# Altium schematic sheet Connection Powermodule.SchDoc
size A4; SheetNumber: 3; SheetTotal: 6
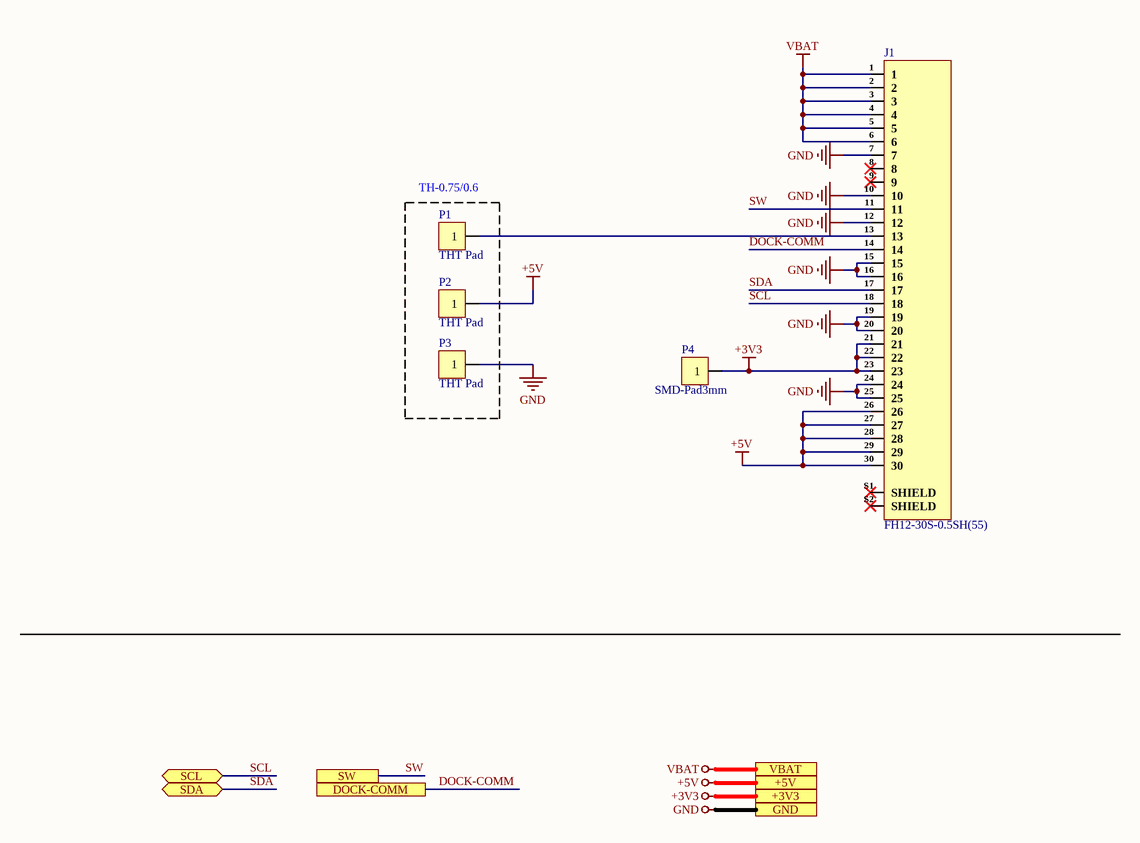
[diagram p0: Connection Powermodule.SchDoc]

## Parts
J1  FH12-30S-0.5SH(55)  [FH12-30S-0.5SH(55)]
P1  THT Pad  [TH-0.75/0.6]  (no BOM)
P2  THT Pad  [TH-0.75/0.6]  (no BOM)
P3  THT Pad  [TH-0.75/0.6]  (no BOM)
P4  SMD-Pad3mm  [3mm SMD PAD]  (no BOM)

## Blocks framed on the sheet
TH-0.75/0.6: P1-P3

## Ports
+3V3 (see Top-Sheet[3A], IO-Extender[3D]), +5V (see Top-Sheet[3A], HMI Part[3D], IO-Extender[3D], MOSFET Driving[2D], Pad Connections[3D]), DOCK-COMM (see Top-Sheet[4B], Pad Connections[1D]), GND (see Top-Sheet[3A], HMI Part[3D], IO-Extender[3D], MOSFET Driving[2D], Pad Connections[3D]), SCL (bidir, see Top-Sheet[3B], IO-Extender[1D], Pad Connections[1D]), SDA (bidir, see Top-Sheet[3B], IO-Extender[1D], Pad Connections[1D]), SW (see Top-Sheet[3B], HMI Part[2D]), VBAT (see Top-Sheet[3A], MOSFET Driving[2D], Pad Connections[3D])

## Nets
+3V3: J1.21 J1.22 J1.23 P4.1 ; port +3V3
+5V: J1.26 J1.27 J1.28 J1.29 J1.30 P2.1 ; port +5V
GND: J1.7 J1.10 J1.12 J1.15 J1.16 J1.19 J1.20 J1.24 J1.25 P3.1 ; port GND
VBAT: J1.1 J1.2 J1.3 J1.4 J1.5 J1.6 ; port VBAT
DOCK-COMM: J1.14 ; port DOCK-COMM
SCL: J1.18 ; port SCL
SDA: J1.17 ; port SDA
SW: J1.11 ; port SW
NetJ1_13: J1.13 P1.1

Not connected (* = marked no-connect by the designer): J1 8* 9* S1(SHIELD)* S2(SHIELD)*

## Notes on the sheet
- File:
- Title:
- Date:
- Page
- Num:
- Total:
- Drawn By: Huzaifa Ali

## Library data of the parts
J1 = FH12-30S-0.5SH(55): CONN FFC BOTTOM 30POS 0.5MM R/A; Manufacturer: Hirose; Actuator Material: Polyphenylene; Actuator Color: Brown; Contact Resistance: 50mR; Current Rating: 500mA; Gender: Female; Voltage Rating: 50V; Max Current Rating: 400mA; Mating Cycles: 20; Number of Positions: 30; Insulation Resistance: 500MR; Wire/Cable Type: Straight; Connector Type: 4640ConnectorType; Contact Pitch: 500um; Item Type: FFC/FPC Connector; Supplier: Future Electronics; Supplier Part Number: 7018136; Manufacturer Part Number: FH12-30S-0.5SH(55); RoHS: Yes; Category: FFC / FPC; Stock: 1200; Pricing: 1=2.27, 15=2.07, 50=1.97, 250=1.85, 1000=1.75 (USD); Mounting Technology: Surface Mount; Contact Material: Bronze; Contact Plating: Gold; Color: Beige,Brown; Housing Color: Beige; Housing Material: Polyamide; Material: Polyamide; Min Operating Temperature: -40°C; Max Operating Temperature: 70°C; Number of Rows: 1; Package Quantity: 2000; Packaging: Tape and Reel; Voltage Rating (AC): 50V; Termination: Solder; Number of Contacts: 30; Max Voltage Rating (AC): 50V; Orientation: Right Angle; Series: FH12; Contact Location: Bottom; Contact Voltage Rating (AC): 50V; Length: 19.1mm; Width: 19.1mm; Lead Pitch: 0.5mm; Pitch: 0.5mm; Depth: 5.6mm; Radiation Hardening: No; Reach SVHC Compliant: No; Lead Free: Lead Free; Flammability Rating: UL94 V-0; RoHS Compliant: Yes; ComponentLink1URL: https://datasheet.ciiva.com/11745/0900766b80d985fc-11745247.pdf?src-supplier=Rs; ComponentLink1Description: https://datasheet.ciiva.com/11745/0900766b80d985fc-11745247.pdf?src-supplier=Rs; ComponentLink2URL: https://datasheet.ciiva.com/15176/getdatasheetpartid-439676-15176854.pdf?src-supplier=Verical; ComponentLink2Description: https://datasheet.ciiva.com/15176/getdatasheetpartid-439676-15176854.pdf?src-supplier=Verical; ComponentLink3URL: https://datasheet.ciiva.com/7661/58803-7661387.pdf?src-supplier=Element14; ComponentLink3Description: https://datasheet.ciiva.com/7661/58803-7661387.pdf?src-supplier=Element14; ComponentLink4URL: https://datasheet.ciiva.com/22630/58803-22630360.pdf?src-supplier=Farnell; ComponentLink4Description: https://datasheet.ciiva.com/22630/58803-22630360.pdf?src-supplier=Farnell; LCSC Part Number: C506793
P1-P3 = TH-0.75/0.6
P4 = SMD-Pad3mm: Wire Conncting PAD